# Altium schematic sheet 02_DDR3L.SchDoc
size A4; SheetNumber: 2; SheetTotal: 12
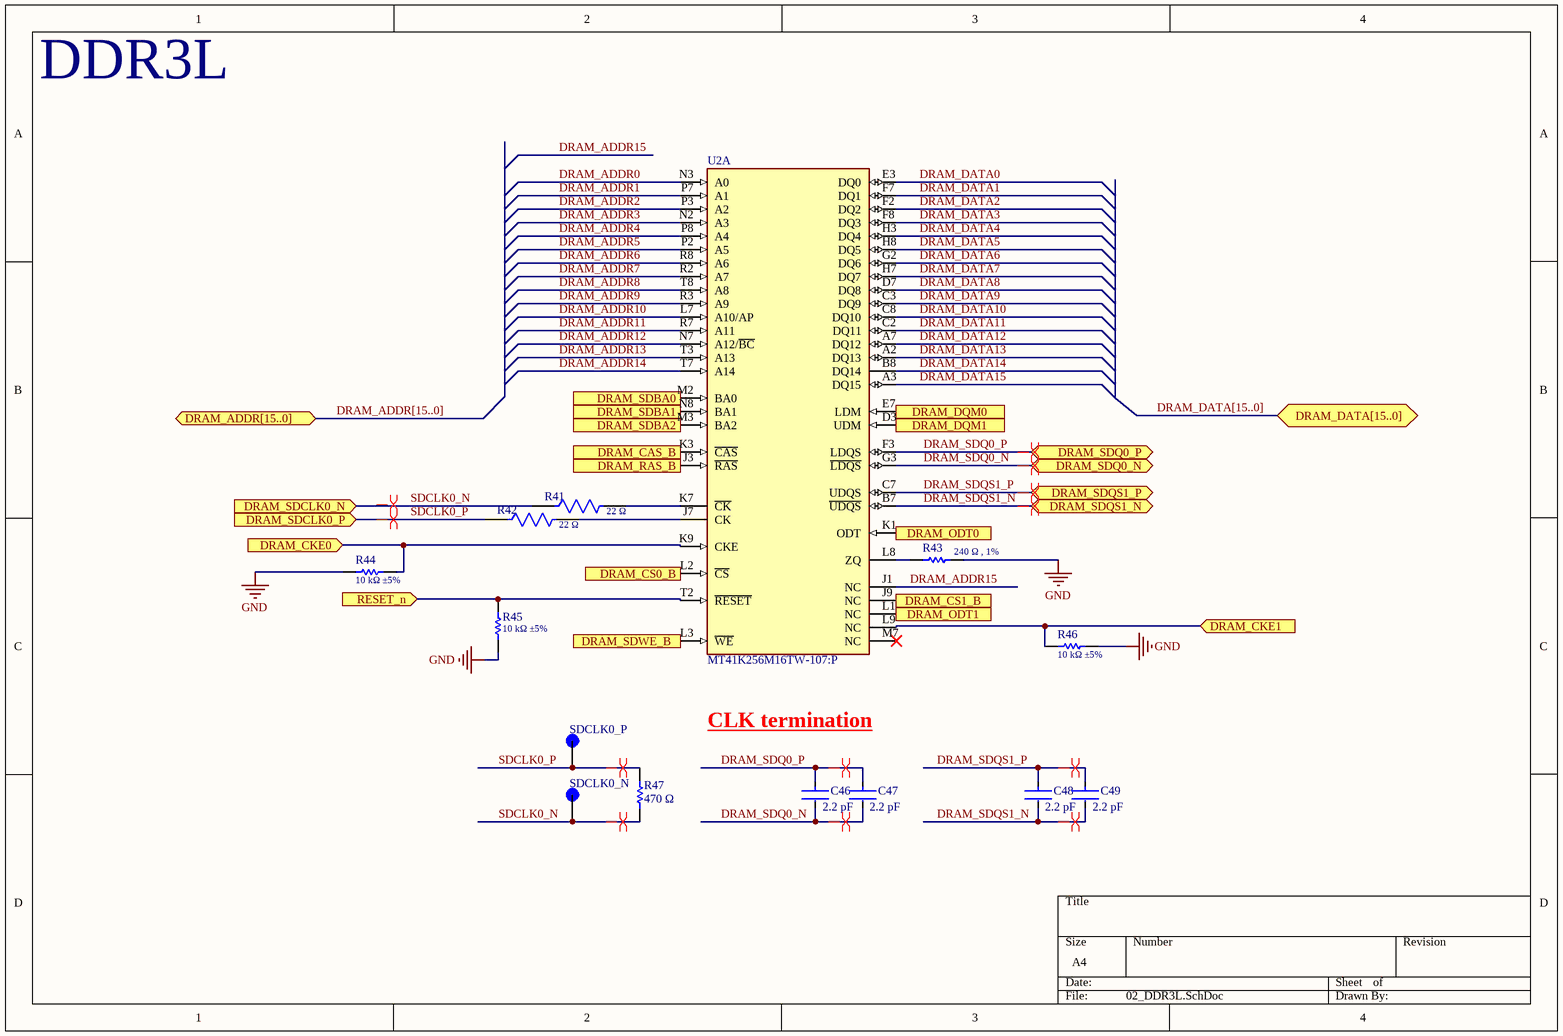
[diagram p0: 02_DDR3L.SchDoc]

## Parts
C46  2.2 pF  [FP-C0603C-CF-MFG]
C47  2.2 pF  [FP-C0603C-CF-MFG]
C48  2.2 pF  [FP-C0603C-CF-MFG]
C49  2.2 pF  [FP-C0603C-CF-MFG]
R41  22 Ω  [FP-RC0603-0_55-IPC_C]
R42  22 Ω  [FP-RC0603-0_55-IPC_C]
R43  240 Ω , 1%  [RESC0603(1608)_L]
R44  10 kΩ ±5%  [RESC1608X55X25ML10T15]
R45  10 kΩ ±5%  [RESC1608X55X25ML10T15]
R46  10 kΩ ±5%  [RESC1608X55X25ML10T15]
R47  470 Ω  [RESC1608X55X25LL10T15]
SDCLK0_N  (no value)  [KEYSTONE_5277]
SDCLK0_P  (no value)  [KEYSTONE_5277]
U2  MT41K256M16TW-107:P  [FP-TW-IPC_C]  (part A of 2)

## Ports
DRAM_ADDR[15..0] (bidir), DRAM_CAS_B (in), DRAM_CKE0 (in), DRAM_CKE1 (in), DRAM_CS0_B (in), DRAM_CS1_B (in), DRAM_DATA[15..0] (bidir), DRAM_DQM0 (in), DRAM_DQM1 (in), DRAM_ODT0 (in), DRAM_ODT1 (in), DRAM_RAS_B (in), DRAM_SDBA0 (in), DRAM_SDBA1 (in), DRAM_SDBA2 (in), DRAM_SDCLK0_N (in), DRAM_SDCLK0_P (in), DRAM_SDQ0_N (bidir), DRAM_SDQ0_P (bidir), DRAM_SDQS1_N (bidir), DRAM_SDQS1_P (bidir), DRAM_SDWE_B (in), RESET_n (in)

## Nets
GND: R43.2 R44.2 R45.1 R46.1
DRAM_ADDR0: U2.N3(A0)
DRAM_ADDR1: U2.P7(A1)
DRAM_ADDR2: U2.P3(A2)
DRAM_ADDR3: U2.N2(A3)
DRAM_ADDR4: U2.P8(A4)
DRAM_ADDR5: U2.P2(A5)
DRAM_ADDR6: U2.R8(A6)
DRAM_ADDR7: U2.R2(A7)
DRAM_ADDR8: U2.T8(A8)
DRAM_ADDR9: U2.R3(A9)
DRAM_ADDR10: U2.L7(A10/AP)
DRAM_ADDR11: U2.R7(A11)
DRAM_ADDR12: U2.N7(A12/~{BC})
DRAM_ADDR13: U2.T3(A13)
DRAM_ADDR14: U2.T7(A14)
DRAM_ADDR15: U2.J1(NC)
DRAM_CAS_B: U2.K3(~{CAS}) ; port DRAM_CAS_B
DRAM_CKE0: R44.1 U2.K9(CKE) ; port DRAM_CKE0
DRAM_CKE1: R46.2 U2.L9(NC) ; port DRAM_CKE1
DRAM_CS0_B: U2.L2(~{CS}) ; port DRAM_CS0_B
DRAM_CS1_B: U2.J9(NC) ; port DRAM_CS1_B
DRAM_DATA0: U2.E3(DQ0)
DRAM_DATA1: U2.F7(DQ1)
DRAM_DATA2: U2.F2(DQ2)
DRAM_DATA3: U2.F8(DQ3)
DRAM_DATA4: U2.H3(DQ4)
DRAM_DATA5: U2.H8(DQ5)
DRAM_DATA6: U2.G2(DQ6)
DRAM_DATA7: U2.H7(DQ7)
DRAM_DATA8: U2.D7(DQ8)
DRAM_DATA9: U2.C3(DQ9)
DRAM_DATA10: U2.C8(DQ10)
DRAM_DATA11: U2.C2(DQ11)
DRAM_DATA12: U2.A7(DQ12)
DRAM_DATA13: U2.A2(DQ13)
DRAM_DATA14: U2.B8(DQ14)
DRAM_DATA15: U2.A3(DQ15)
DRAM_DQM0: U2.E7(LDM) ; port DRAM_DQM0
DRAM_DQM1: U2.D3(UDM) ; port DRAM_DQM1
DRAM_ODT0: U2.K1(ODT) ; port DRAM_ODT0
DRAM_ODT1: U2.L1(NC) ; port DRAM_ODT1
DRAM_RAS_B: U2.J3(~{RAS}) ; port DRAM_RAS_B
DRAM_SDBA0: U2.M2(BA0) ; port DRAM_SDBA0
DRAM_SDBA1: U2.N8(BA1) ; port DRAM_SDBA1
DRAM_SDBA2: U2.M3(BA2) ; port DRAM_SDBA2
DRAM_SDQ0_N: C46.2 C47.2 U2.G3(~{LDQS}) ; port DRAM_SDQ0_N
DRAM_SDQ0_P: C46.1 C47.1 U2.F3(LDQS) ; port DRAM_SDQ0_P
DRAM_SDQS1_N: C48.2 C49.2 U2.B7(~{UDQS}) ; port DRAM_SDQS1_N
DRAM_SDQS1_P: C48.1 C49.1 U2.C7(UDQS) ; port DRAM_SDQS1_P
DRAM_SDWE_B: U2.L3(~{WE}) ; port DRAM_SDWE_B
RESET_n: R45.2 U2.T2(~{RESET}) ; port RESET_n
SDCLK0_N: R41.1 R47.1 SDCLK0_N.1(TP) ; port DRAM_SDCLK0_N
SDCLK0_P: R42.1 R47.2 SDCLK0_P.1(TP) ; port DRAM_SDCLK0_P
NetR41_2: R41.2 U2.K7(~{CK})
NetR42_2: R42.2 U2.J7(CK)
NetR43_1: R43.1 U2.L8(ZQ)

Not connected (* = marked no-connect by the designer): U2 M7(NC)*

## Buses and harness runs
bus DRAM_ADDR[15..0] = port DRAM_ADDR[15..0]
bus DRAM_DATA[15..0] = port DRAM_DATA[15..0]

## Layout directives
differential pair: (no net found under the mark), DRAM_SDQ0_N, DRAM_SDQ0_P, DRAM_SDQS1_N, DRAM_SDQS1_P, SDCLK0_N, SDCLK0_P

## Notes on the sheet
- DDR3L
- CLK termination

## Library data of the parts
C46-C49 = CMP-1035-00158-3: CAP CER 2.2PF 50V NP0 0603; Manufacturer Part Number: C0603C229C5GACTU; Manufacturer: KEMET; Automotive Grade: Grade 1; Temperature Coefficient: 30ppm/°C; Temperature Characteristic: C0G; Tolerance: 0.25 pF; Material: Ceramic; Lead Free: Yes; Value: 2.2 pF; Voltage Rating: 50 V; Package: C0603C-CF; Category: Cap; RoHS: TRUE; ComponentLink2Description: Datasheet; Capacitance: 2.2 pF; Device Class L2: Capacitors; Digikey Description: CAP CER 2.2PF 50V NP0 0603; Temperature: -55°C to +125°C; Temperature Range Low: -55°C; Mouser Description: Multilayer Ceramic Capacitors MLCC - SMD/SMT 50volts 2.2pF C0G 0.25%; ComponentLink2URL: https://api.kemet.com/component-edge/download/datasheet/C0603C100J5GACAUTO.pdf; Temperature Range High: +125°C; Height: 0.87mm; Automotive: Yes; Device Class L1: Passive Components; Octopart: https://octopart.com/c0603c229c5gactu-kemet-3874912; Device Class L3: Ceramic Capacitors
R41 R42 = CMP-03412-037819-1: RES SMD 22 OHM 5% 1/10W 0603; Temperature Coefficient: 100ppm/°C; Max Power Dissipation: 100mW; Voltage Rating: 50V; Resistance: 22R; Length: 1.6mm; Tolerance: 5%; Resistance Tolerance: 5%; Number of Terminations: 2; Construction: Rectangular; Min Operating Temperature: -55°C; Lead Free: Lead Free; Width: 0.8mm; Case Code (Imperial): 0603; Voltage Rating (DC): 50V; Case/Package: 0603; Features: Moisture Resistant; REACH SVHC: No SVHC; Military Standard: Not; RoHS Compliant: Yes; Max Operating Temperature: 155°C; Number of Pins: 2; Termination: SMD/SMT; Case Code (Metric): 1608; Packaging: Tape and Reel; Resistor Type: Thick Film; Depth: 0.8mm; Size Code: 0603; Power Rating: 100mW; Series: RC
R43 = CMP-1012-00438-1: 240R 0.1W 1% 0603 (1608 Metric)  SMD; Case-EIA: 0603; Value: 240.00 Ohm; Case-Metric: 1608; Technology: SMT; Power: 0.1 W; Tolerance: 1 %
R44-R46 = CMP-2000-05022-1: Resistor, 10 KOhm, +/- 5%, 100 mW, -55 to 155 degC, 0603 (1608 Metric), RoHS, Tape and Reel; Manufacturer: Yageo; Resistance: 10kOhms; Voltage Rating: 50V; Temperature Coefficient: 100PPM/C; Power Rating: 100mW; Package Reference: 603; Series: RC; Case Code - mm: 1608; Packaging: Reel; Datasheet URL: http://www.farnell.com/datasheets/443971.pdf; Datasheet Version: Rev. 4, 04/2009; Operating Temperature Range: -55Cto+155C; Product: ThickFilmResistorsGeneralPurpose; Package Description: 2-Pin Surface Mount Device, Body 1.6 x 0.8 mm; Manufacturer URL: http://www.yageo.com/; Case Code - in: 0603; Tolerance: 5%; Termination Style: SMD/SMT
R47 = CMP-1659-00035-2: General Purpose Chip Resistor, 470 Ohm, +/- 1%, -55 to 155 degC, 0603 (1608 Metric), RoHS, Tape and Reel; Resistance: 470 Ohm; ComponentLink1Description: Manufacturer URL; Contact Plating: Gold; Width: 3.1 mm; Radiation Hardening: No; DatasheetVersion: Rev. 4, 04/2009; Length: 3 mm; PackageDescription: 2-Pin Surface Mount Device, Body 1.6 x 0.8 mm; ComponentLink1URL: http://www.yageo.com/; Min Operating Temperature: -40 degC; Mount: Surface Mount; Package Quantity: 2500; ComponentLink2URL: https://datasheet.ciiva.com/11808/0900766b80f96399-11808177.pdf; RoHSCompliant: true; Fastening Type: Snap; PackageReference: 0603; Max Operating Temperature: 90 degC; Height: 1.25 mm; Packaging: Tape and Reel; ComponentLink2Description: Datasheet; Contact Material: Brass
SDCLK0_N SDCLK0_P = 5277: TEST POINT (BLUE) - COMPACT; MF: Keystone Electronics; SnapEDA_Link: https://www.snapeda.com/parts/5277/Keystone/view-part/?ref=snap; Package: None; Value: *; MP: 5277; Check_prices: https://www.snapeda.com/parts/5277/Keystone/view-part/?ref=eda
U2 = CMP-2000-07475-2: IC DRAM 4G PARALLEL 96FBGA; Manufacturer: Micron; Access Time: 1.07ns; Nominal Supply Current: 12-156mA; Min Supply Voltage: 1.283V; Memory Type: SDRAM,DDR3; Standoff Height: 0.29mm; Max Supply Voltage: 1.45V; Memory Size: 4Gbits; Device Class L1: Integrated Circuits (ICs); Lead Free: Yes; ComponentLink2Description: Datasheet; Manufacturer Part Number: MT41K256M16TW-107:P; Category: IC; Digikey Description: IC DRAM 4G PARALLEL 96FBGA; Device Class L3: RAM; Interface: Parallel; RoHS: TRUE; Octopart: https://octopart.com/mt41k256m16tw-107%3Ap-micron-66533852; Temperature Range High: +85°C; ComponentLink2URL: https://www.micron.com/-/media/client/global/documents/products/data-sheet/dram/ddr3/4gb_ddr3l.pdf; Temperature: 0°C to +85°C; Package: TW; Device Class L2: Memory; Automotive: No; Height: 1.2mm; Temperature Range Low: 0°C